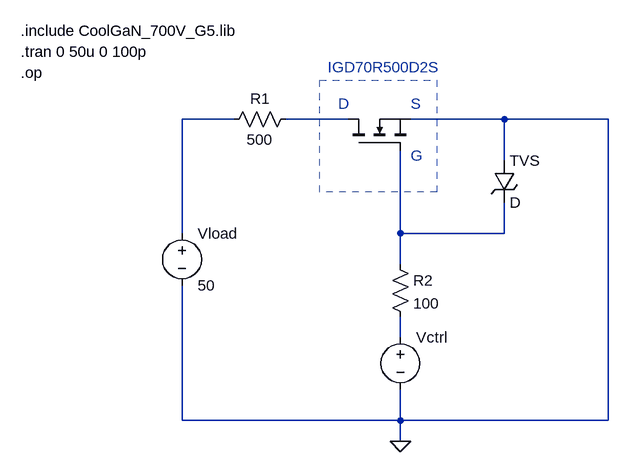
[diagram p0: schematic GaN_Transistor_Test_Board.asc]
GaN_Transistor_Test_Board.asc, the LTspice schematic file:
Version 4
SHEET 1 980 816
WIRE 16 256 -64 256
WIRE 192 256 96 256
WIRE 432 256 288 256
WIRE 592 256 432 256
WIRE 432 320 432 256
WIRE -64 432 -64 256
WIRE 272 432 272 304
WIRE 432 432 432 384
WIRE 432 432 272 432
WIRE 272 480 272 432
WIRE 272 592 272 560
WIRE -64 720 -64 512
WIRE 272 720 272 672
WIRE 272 720 -64 720
WIRE 592 720 592 256
WIRE 592 720 272 720
WIRE 272 752 272 720
FLAG 272 752 0
SYMBOL nmos 192 304 R270
WINDOW 0 56 32 Invisible 2
WINDOW 3 56 72 Invisible 2
SYMATTR InstName X1
SYMATTR Value IGD70R500D2S_L1
SYMATTR Prefix X
SYMBOL Res 112 240 R90
WINDOW 0 0 56 VBottom 2
WINDOW 3 32 56 VTop 2
SYMATTR InstName R1
SYMATTR Value 500
SYMBOL Res 256 464 R0
SYMATTR InstName R2
SYMATTR Value 100
SYMBOL TVSdiode 416 320 R0
SYMATTR InstName TVS
SYMBOL Voltage 272 576 R0
WINDOW 3 24 96 Invisible 2
SYMATTR InstName Vctrl
SYMATTR Value PWL(0 0 5u 0 6u 5 50u 5)
SYMBOL Voltage -64 416 R0
SYMATTR InstName Vload
SYMATTR Value 50
TEXT -312 120 Left 2 !.include CoolGaN_700V_G5.lib
TEXT -312 184 Left 2 !.op
TEXT -312 152 Left 2 !.tran 0 50u 0 100p
TEXT 176 232 Left 2 ;D
TEXT 288 232 Left 2 ;S
TEXT 288 312 Left 2 ;G
TEXT 160 176 Left 2 ;IGD70R500D2S
RECTANGLE Normal 328 368 148 196 2

The netlist it stands for:
* GaN_Transistor_Test_Board.asc
XX1 N002 N003 0 IGD70R500D2S_L1  ; pins D G S
R1 N002 N001 500
R2 N003 N004 100
D§TVS 0 N003 D
Vctrl N004 0 PWL(0 0 5u 0 6u 5 50u 5)
Vload N001 0 50
.model D D
.lib standard.dio
.include CoolGaN_700V_G5.lib
.op
.tran 0 50u 0 100p
* D
* S
* G
* IGD70R500D2S
.backanno
.end